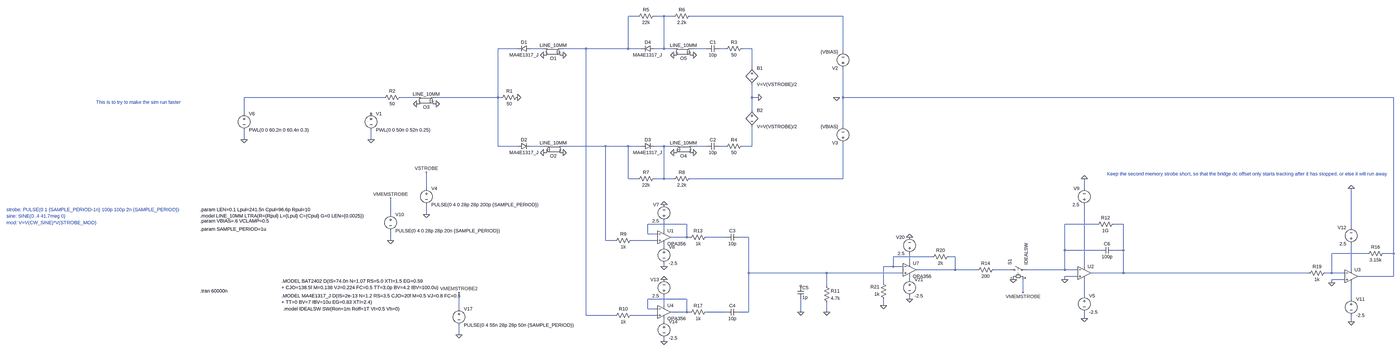
[diagram p0: schematic somewhat-usable.asc, whole sheet]
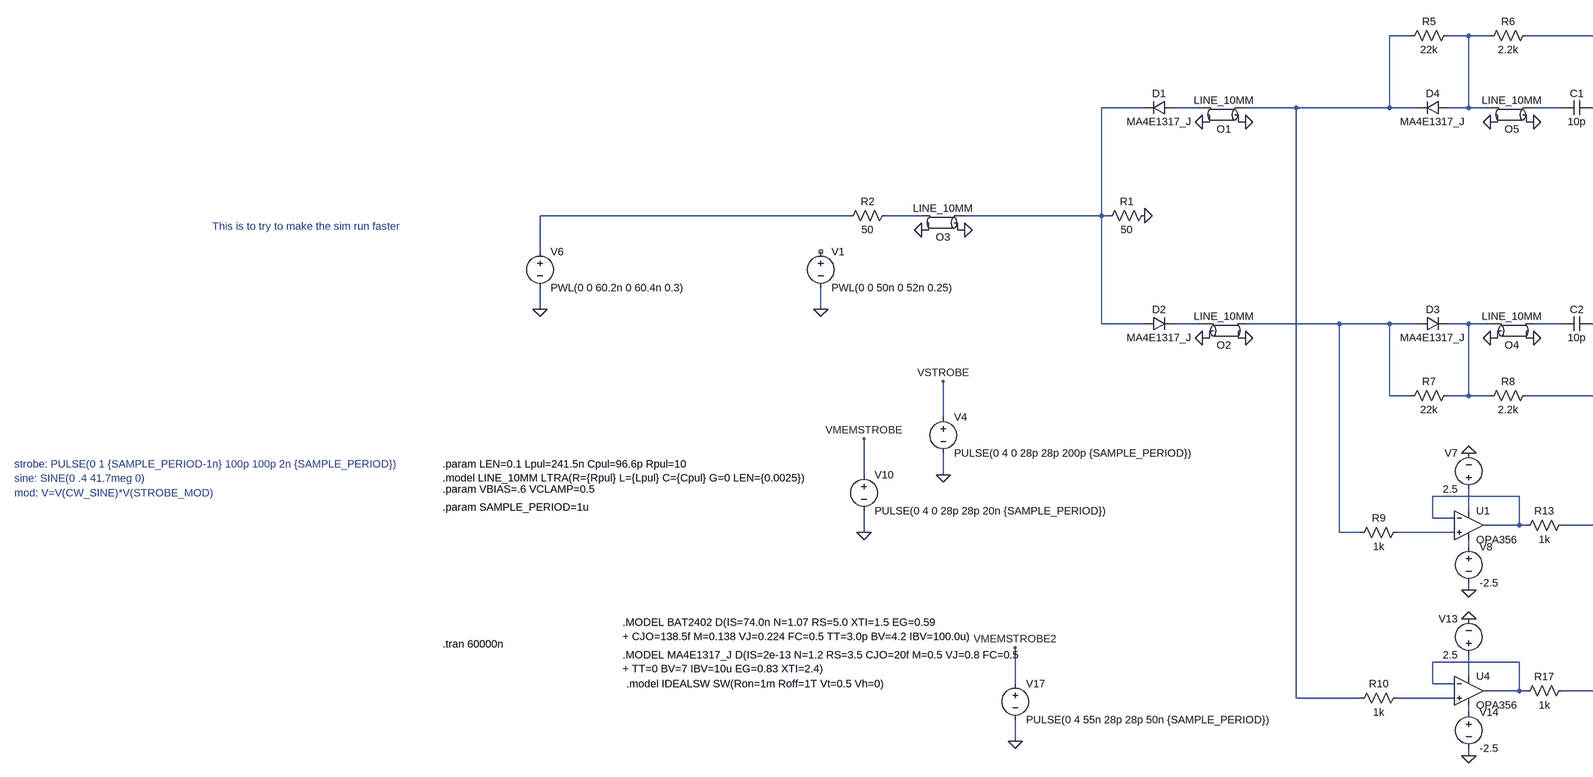
[diagram p1: schematic somewhat-usable.asc, part, row 1 of 1, column 1 of 2]
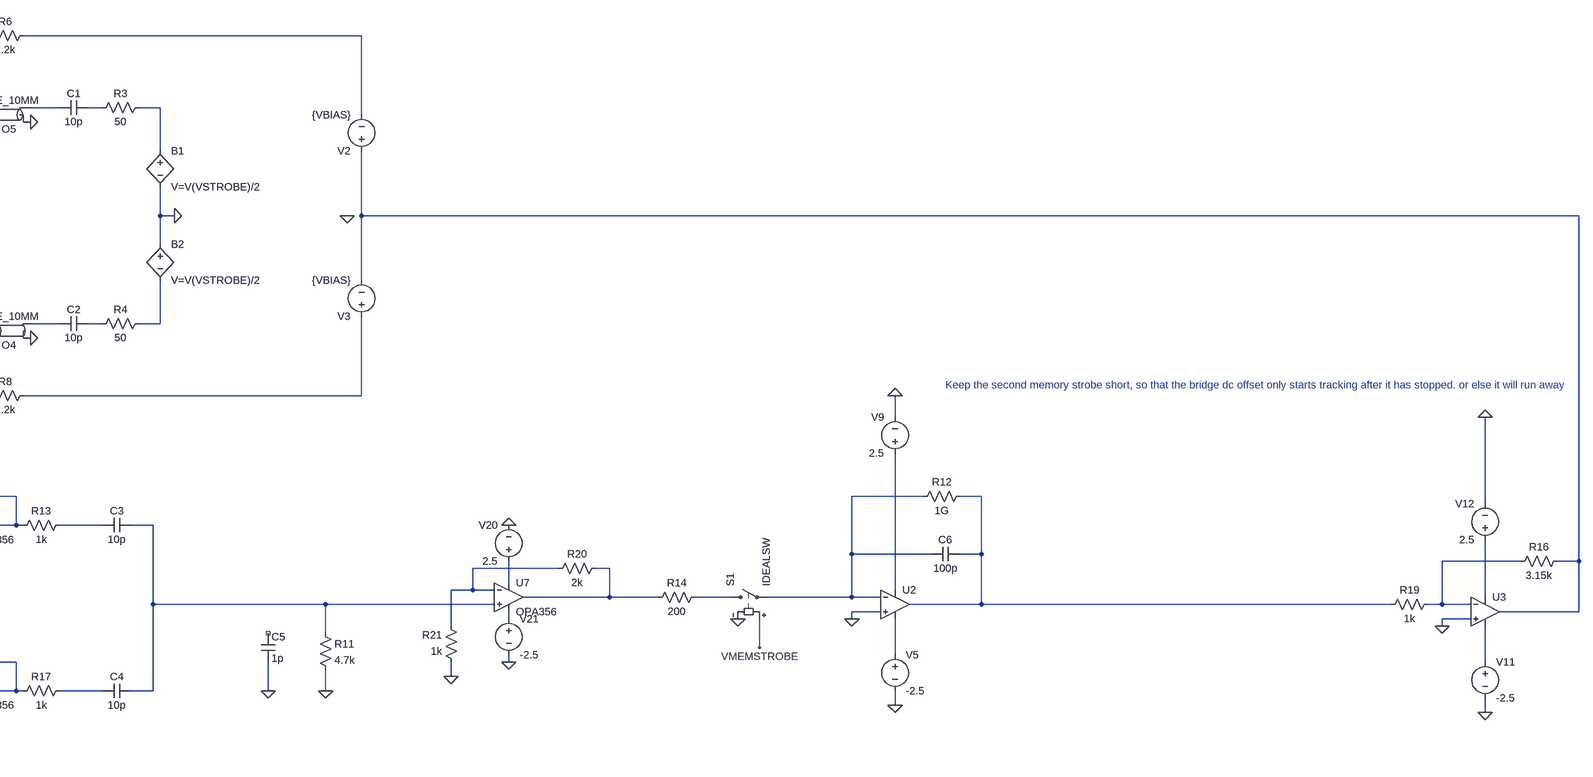
[diagram p2: schematic somewhat-usable.asc, part, row 1 of 1, column 2 of 2]
somewhat-usable.asc, the LTspice schematic file:
Version 4
SHEET 1 6100 1460
WIRE 1440 -656 1392 -656
WIRE 1568 -656 1520 -656
WIRE 1616 -656 1568 -656
WIRE 2448 -656 1696 -656
WIRE 848 -496 752 -496
WIRE 976 -496 912 -496
WIRE 1184 -496 1072 -496
WIRE 1392 -496 1392 -656
WIRE 1392 -496 1184 -496
WIRE 1456 -496 1392 -496
WIRE 1568 -496 1568 -656
WIRE 1568 -496 1520 -496
WIRE 1616 -496 1568 -496
WIRE 1776 -496 1712 -496
WIRE 1872 -496 1840 -496
WIRE 2000 -496 1952 -496
WIRE 2448 -480 2448 -656
WIRE 2000 -400 2000 -496
WIRE 192 -256 -496 -256
WIRE 352 -256 272 -256
WIRE 752 -256 752 -496
WIRE 752 -256 448 -256
WIRE 768 -256 752 -256
WIRE 2000 -256 2000 -320
WIRE 2032 -256 2000 -256
WIRE 2448 -256 2448 -400
WIRE 5504 -256 2448 -256
WIRE 2000 -192 2000 -256
WIRE -496 -176 -496 -256
WIRE 2448 -112 2448 -256
WIRE -496 -48 -496 -96
WIRE 128 -48 128 -96
WIRE 752 -16 752 -256
WIRE 848 -16 752 -16
WIRE 976 -16 912 -16
WIRE 1280 -16 1072 -16
WIRE 1392 -16 1280 -16
WIRE 1456 -16 1392 -16
WIRE 1568 -16 1520 -16
WIRE 1616 -16 1568 -16
WIRE 1776 -16 1712 -16
WIRE 1872 -16 1840 -16
WIRE 2000 -16 2000 -112
WIRE 2000 -16 1952 -16
WIRE 1392 144 1392 -16
WIRE 1440 144 1392 144
WIRE 1568 144 1568 -16
WIRE 1568 144 1520 144
WIRE 1616 144 1568 144
WIRE 2448 144 2448 -32
WIRE 2448 144 1696 144
WIRE 400 192 400 112
WIRE 3984 192 3984 144
WIRE 224 320 224 240
WIRE 400 320 400 272
WIRE 1680 368 1488 368
WIRE 4048 368 3888 368
WIRE 4176 368 4128 368
WIRE 5296 384 5296 192
WIRE 1568 400 1568 352
WIRE 1488 416 1488 368
WIRE 1536 416 1488 416
WIRE 1680 432 1680 368
WIRE 1680 432 1600 432
WIRE 1696 432 1680 432
WIRE 1872 432 1776 432
WIRE 1984 432 1936 432
WIRE 224 448 224 400
WIRE 1280 448 1280 -16
WIRE 1328 448 1280 448
WIRE 1536 448 1408 448
WIRE 1568 480 1568 464
WIRE 3888 496 3888 368
WIRE 4064 496 3888 496
WIRE 4176 496 4176 368
WIRE 4176 496 4128 496
WIRE 5376 512 5200 512
WIRE 5504 512 5504 -256
WIRE 5504 512 5456 512
WIRE 2912 528 2720 528
WIRE 3024 528 2992 528
WIRE 2800 560 2800 512
WIRE 1568 576 1568 560
WIRE 2720 576 2720 528
WIRE 2720 576 2672 576
WIRE 2768 576 2720 576
WIRE 3984 576 3984 272
WIRE 3024 592 3024 528
WIRE 3024 592 2832 592
WIRE 3312 592 3024 592
WIRE 3472 592 3392 592
WIRE 3888 592 3888 496
WIRE 3888 592 3552 592
WIRE 3952 592 3888 592
WIRE 5296 592 5296 464
WIRE 1984 608 1984 432
WIRE 2368 608 1984 608
WIRE 2768 608 2368 608
WIRE 4176 608 4176 496
WIRE 4176 608 4016 608
WIRE 5088 608 4176 608
WIRE 5200 608 5200 512
WIRE 5200 608 5168 608
WIRE 5264 608 5200 608
WIRE 3952 624 3888 624
WIRE 5504 624 5504 512
WIRE 5504 624 5328 624
WIRE 2800 640 2800 624
WIRE 3888 640 3888 624
WIRE 5264 640 5200 640
WIRE 2672 656 2672 576
WIRE 5200 656 5200 640
WIRE 2368 672 2368 608
WIRE 3536 704 3536 640
WIRE 3984 720 3984 640
WIRE 1680 736 1488 736
WIRE 2800 736 2800 720
WIRE 5296 736 5296 656
WIRE 1568 768 1568 720
WIRE 2672 768 2672 736
WIRE 560 784 560 704
WIRE 1488 784 1488 736
WIRE 1536 784 1488 784
WIRE 1680 800 1680 736
WIRE 1680 800 1600 800
WIRE 1696 800 1680 800
WIRE 1872 800 1776 800
WIRE 1984 800 1984 608
WIRE 1984 800 1936 800
WIRE 2240 800 2240 736
WIRE 2368 800 2368 752
WIRE 1184 816 1184 -496
WIRE 1328 816 1184 816
WIRE 1536 816 1408 816
WIRE 3984 832 3984 800
WIRE 1568 848 1568 832
WIRE 5296 848 5296 816
WIRE 560 912 560 864
WIRE 1568 944 1568 928
FLAG 128 -48 0
FLAG 1072 16 0
FLAG 976 16 0
FLAG 976 -464 0
FLAG 1072 -464 0
FLAG 448 -224 0
FLAG 352 -224 0
FLAG 848 -256 0
FLAG 1712 16 0
FLAG 1616 16 0
FLAG 1616 -464 0
FLAG 1712 -464 0
FLAG 2032 -256 0
FLAG 400 320 0
FLAG 400 112 VSTROBE
FLAG 2416 -256 0
FLAG -496 -48 0
FLAG 2368 800 0
FLAG 2240 800 0
FLAG 3888 640 0
FLAG 3984 144 0
FLAG 3984 832 0
FLAG 224 448 0
FLAG 224 240 VMEMSTROBE
FLAG 3536 704 VMEMSTROBE
FLAG 3488 640 0
FLAG 5200 656 0
FLAG 5296 192 0
FLAG 5296 848 0
FLAG 560 912 0
FLAG 560 704 VMEMSTROBE2
FLAG 2800 736 0
FLAG 2800 432 0
FLAG 2672 768 0
FLAG 1568 576 0
FLAG 1568 272 0
FLAG 1568 944 0
FLAG 1568 640 0
SYMBOL voltage 128 -192 R0
WINDOW 123 0 0 Left 0
WINDOW 39 0 0 Left 0
SYMATTR InstName V1
SYMATTR Value PWL(0 0 50n 0 52n 0.25)
SYMBOL diode 912 -512 R90
WINDOW 0 0 32 VBottom 2
WINDOW 3 32 32 VTop 2
SYMATTR InstName D1
SYMATTR Value MA4E1317_J
SYMBOL ltline 1024 -480 R180
SYMATTR InstName O1
SYMATTR Value LINE_10MM
SYMBOL ltline 1024 0 M180
SYMATTR InstName O2
SYMATTR Value LINE_10MM
SYMBOL diode 848 -32 M90
WINDOW 0 0 32 VBottom 2
WINDOW 3 32 32 VTop 2
SYMATTR InstName D2
SYMATTR Value MA4E1317_J
SYMBOL diode 1456 -32 M90
WINDOW 0 0 32 VBottom 2
WINDOW 3 32 32 VTop 2
SYMATTR InstName D3
SYMATTR Value MA4E1317_J
SYMBOL diode 1520 -512 R90
WINDOW 0 0 32 VBottom 2
WINDOW 3 32 32 VTop 2
SYMATTR InstName D4
SYMATTR Value MA4E1317_J
SYMBOL res 864 -272 R90
WINDOW 0 0 56 VBottom 2
WINDOW 3 32 56 VTop 2
SYMATTR InstName R1
SYMATTR Value 50
SYMBOL ltline 400 -240 R180
SYMATTR InstName O3
SYMATTR Value LINE_10MM
SYMBOL res 288 -272 R90
WINDOW 0 0 56 VBottom 2
WINDOW 3 32 56 VTop 2
SYMATTR InstName R2
SYMATTR Value 50
SYMBOL ltline 1664 0 M180
SYMATTR InstName O4
SYMATTR Value LINE_10MM
SYMBOL ltline 1664 -480 R180
SYMATTR InstName O5
SYMATTR Value LINE_10MM
SYMBOL cap 1840 -512 R90
WINDOW 0 0 32 VBottom 2
WINDOW 3 32 32 VTop 2
SYMATTR InstName C1
SYMATTR Value 10p
SYMBOL cap 1840 -32 R90
WINDOW 0 0 32 VBottom 2
WINDOW 3 32 32 VTop 2
SYMATTR InstName C2
SYMATTR Value 10p
SYMBOL res 1968 -512 R90
WINDOW 0 0 56 VBottom 2
WINDOW 3 32 56 VTop 2
SYMATTR InstName R3
SYMATTR Value 50
SYMBOL res 1968 -32 R90
WINDOW 0 0 56 VBottom 2
WINDOW 3 32 56 VTop 2
SYMATTR InstName R4
SYMATTR Value 50
SYMBOL voltage 400 176 R0
WINDOW 123 0 0 Left 0
WINDOW 39 0 0 Left 0
SYMATTR InstName V4
SYMATTR Value PULSE(0 4 0 28p 28p 200p {SAMPLE_PERIOD})
SYMBOL bv 2000 -416 R0
SYMATTR InstName B1
SYMATTR Value V=V(VSTROBE)/2
SYMBOL bv 2000 -208 R0
SYMATTR InstName B2
SYMATTR Value V=V(VSTROBE)/2
SYMBOL res 1536 -672 R90
WINDOW 0 0 56 VBottom 2
WINDOW 3 32 56 VTop 2
SYMATTR InstName R5
SYMATTR Value 22k
SYMBOL res 1712 -672 R90
WINDOW 0 0 56 VBottom 2
WINDOW 3 32 56 VTop 2
SYMATTR InstName R6
SYMATTR Value 2.2k
SYMBOL res 1536 128 R90
WINDOW 0 0 56 VBottom 2
WINDOW 3 32 56 VTop 2
SYMATTR InstName R7
SYMATTR Value 22k
SYMBOL res 1712 128 R90
WINDOW 0 0 56 VBottom 2
WINDOW 3 32 56 VTop 2
SYMATTR InstName R8
SYMATTR Value 2.2k
SYMBOL voltage 2448 -384 R180
WINDOW 123 0 0 Left 0
WINDOW 39 0 0 Left 0
SYMATTR InstName V2
SYMATTR Value {VBIAS}
SYMBOL voltage 2448 -16 R180
WINDOW 123 0 0 Left 0
WINDOW 39 0 0 Left 0
SYMATTR InstName V3
SYMATTR Value {VBIAS}
SYMBOL res 1424 432 R90
WINDOW 0 0 56 VBottom 2
WINDOW 3 32 56 VTop 2
SYMATTR InstName R9
SYMATTR Value 1k
SYMBOL res 1424 800 R90
WINDOW 0 0 56 VBottom 2
WINDOW 3 32 56 VTop 2
SYMATTR InstName R10
SYMATTR Value 1k
SYMBOL cap 1936 416 R90
WINDOW 0 0 32 VBottom 2
WINDOW 3 32 32 VTop 2
SYMATTR InstName C3
SYMATTR Value 10p
SYMBOL cap 1936 784 R90
WINDOW 0 0 32 VBottom 2
WINDOW 3 32 32 VTop 2
SYMATTR InstName C4
SYMATTR Value 10p
SYMBOL voltage -496 -192 R0
WINDOW 123 0 0 Left 0
WINDOW 39 0 0 Left 0
SYMATTR InstName V6
SYMATTR Value PWL(0 0 60.2n 0 60.4n 0.3)
SYMBOL res 2352 656 R0
SYMATTR InstName R11
SYMATTR Value 4.7k
SYMBOL cap 2224 672 R0
SYMATTR InstName C5
SYMATTR Value 1p
SYMBOL res 3408 576 R90
WINDOW 0 0 56 VBottom 2
WINDOW 3 32 56 VTop 2
SYMATTR InstName R14
SYMATTR Value 200
SYMBOL sw 3456 592 R270
SYMATTR InstName S1
SYMATTR Value IDEALSW
SYMBOL OpAmps\\UniversalOpamp2 3984 608 R0
SYMATTR InstName U2
SYMATTR Value2 Avol=1Meg GBW=100Meg Slew=100Meg
SYMBOL cap 4128 480 R90
WINDOW 0 0 32 VBottom 2
WINDOW 3 32 32 VTop 2
SYMATTR InstName C6
SYMATTR Value 100p
SYMBOL voltage 3984 704 R0
WINDOW 123 0 0 Left 0
WINDOW 39 0 0 Left 0
SYMATTR InstName V5
SYMATTR Value -2.5
SYMBOL voltage 3984 288 R180
WINDOW 0 24 96 Left 2
WINDOW 3 24 16 Left 2
WINDOW 123 0 0 Left 0
WINDOW 39 0 0 Left 0
SYMATTR InstName V9
SYMATTR Value 2.5
SYMBOL voltage 224 304 R0
WINDOW 123 0 0 Left 0
WINDOW 39 0 0 Left 0
SYMATTR InstName V10
SYMATTR Value PULSE(0 4 0 28p 28p 20n {SAMPLE_PERIOD})
SYMBOL OpAmps\\UniversalOpamp2 5296 624 R0
SYMATTR InstName U3
SYMATTR Value2 Avol=1Meg GBW=100Meg Slew=100Meg
SYMBOL voltage 5296 720 R0
WINDOW 123 0 0 Left 0
WINDOW 39 0 0 Left 0
SYMATTR InstName V11
SYMATTR Value -2.5
SYMBOL voltage 5296 480 R180
WINDOW 0 24 96 Left 2
WINDOW 3 24 16 Left 2
WINDOW 123 0 0 Left 0
WINDOW 39 0 0 Left 0
SYMATTR InstName V12
SYMATTR Value 2.5
SYMBOL res 5472 496 R90
WINDOW 0 0 56 VBottom 2
WINDOW 3 32 56 VTop 2
SYMATTR InstName R16
SYMATTR Value 3.15k
SYMBOL voltage 560 768 R0
WINDOW 123 0 0 Left 0
WINDOW 39 0 0 Left 0
SYMATTR InstName V17
SYMATTR Value PULSE(0 4 55n 28p 28p 50n {SAMPLE_PERIOD})
SYMBOL res 5184 592 R90
WINDOW 0 0 56 VBottom 2
WINDOW 3 32 56 VTop 2
SYMATTR InstName R19
SYMATTR Value 1k
SYMBOL OPA356 2800 528 R0
SYMATTR InstName U7
SYMBOL voltage 2800 528 R180
WINDOW 0 24 96 Left 2
WINDOW 3 24 16 Left 2
WINDOW 123 0 0 Left 0
WINDOW 39 0 0 Left 0
SYMATTR InstName V20
SYMATTR Value 2.5
SYMBOL voltage 2800 624 R0
WINDOW 123 0 0 Left 0
WINDOW 39 0 0 Left 0
SYMATTR InstName V21
SYMATTR Value -2.5
SYMBOL res 3008 512 R90
WINDOW 0 0 56 VBottom 2
WINDOW 3 32 56 VTop 2
SYMATTR InstName R20
SYMATTR Value 2k
SYMBOL res 2688 752 R180
WINDOW 0 36 76 Left 2
WINDOW 3 36 40 Left 2
SYMATTR InstName R21
SYMATTR Value 1k
SYMBOL res 4144 352 R90
WINDOW 0 0 56 VBottom 2
WINDOW 3 32 56 VTop 2
SYMATTR InstName R12
SYMATTR Value 1G
SYMBOL OPA356 1568 368 R0
SYMATTR InstName U1
SYMBOL voltage 1568 368 R180
WINDOW 0 24 96 Left 2
WINDOW 3 24 16 Left 2
WINDOW 123 0 0 Left 0
WINDOW 39 0 0 Left 0
SYMATTR InstName V7
SYMATTR Value 2.5
SYMBOL voltage 1568 464 R0
WINDOW 123 0 0 Left 0
WINDOW 39 0 0 Left 0
SYMATTR InstName V8
SYMATTR Value -2.5
SYMBOL OPA356 1568 736 R0
SYMATTR InstName U4
SYMBOL voltage 1568 736 R180
WINDOW 0 24 96 Left 2
WINDOW 3 24 16 Left 2
WINDOW 123 0 0 Left 0
WINDOW 39 0 0 Left 0
SYMATTR InstName V13
SYMATTR Value 2.5
SYMBOL voltage 1568 832 R0
WINDOW 123 0 0 Left 0
WINDOW 39 0 0 Left 0
SYMATTR InstName V14
SYMATTR Value -2.5
SYMBOL res 1792 416 R90
WINDOW 0 0 56 VBottom 2
WINDOW 3 32 56 VTop 2
SYMATTR InstName R13
SYMATTR Value 1k
SYMBOL res 1792 784 R90
WINDOW 0 0 56 VBottom 2
WINDOW 3 32 56 VTop 2
SYMATTR InstName R17
SYMATTR Value 1k
TEXT -312 648 Left 2 !.MODEL BAT2402 D(IS=74.0n N=1.07 RS=5.0 XTI=1.5 EG=0.59\n+ CJO=138.5f M=0.138 VJ=0.224 FC=0.5 TT=3.0p BV=4.2 IBV=100.0u)
TEXT -712 296 Left 2 !.param LEN=0.1 Lpul=241.5n Cpul=96.6p Rpul=10\n.model LINE_10MM LTRA(R={Rpul} L={Lpul} C={Cpul} G=0 LEN={0.0025})
TEXT -712 696 Left 2 !.tran 60000n
TEXT -712 352 Left 2 !.param VBIAS=.6 VCLAMP=0.5
TEXT -312 720 Left 2 !.MODEL MA4E1317_J D(IS=2e-13 N=1.2 RS=3.5 CJO=20f M=0.5 VJ=0.8 FC=0.5\n+ TT=0 BV=7 IBV=10u EG=0.83 XTI=2.4)
TEXT -1224 -232 Left 2 ;This is to try to make the sim run faster
TEXT -712 392 Left 2 !.param SAMPLE_PERIOD=1u
TEXT -1664 296 Left 2 ;strobe: PULSE(0 1 {SAMPLE_PERIOD-1n} 100p 100p 2n {SAMPLE_PERIOD})
TEXT -1664 328 Left 2 ;sine: SINE(0 .4 41.7meg 0)
TEXT -1664 360 Left 2 ;mod: V=V(CW_SINE)*V(STROBE_MOD)
TEXT -304 784 Left 2 !.model IDEALSW SW(Ron=1m Roff=1T Vt=0.5 Vh=0)
TEXT 4096 120 Left 2 ;Keep the second memory strobe short, so that the bridge dc offset only starts tracking after it has stopped. or else it will run away

The netlist it stands for:
* somewhat-usable.asc
V1 NC_01 0 PWL(0 0 50n 0 52n 0.25)
D1 N005 N004 MA4E1317_J
O1 0 N001 0 N005 LINE_10MM
O2 0 N012 0 N013 LINE_10MM
D2 N004 N012 MA4E1317_J
D3 N013 N014 MA4E1317_J
D4 N002 N001 MA4E1317_J
R1 0 N004 50
O3 0 N004 0 N010 LINE_10MM
R2 N010 N009 50
O4 0 N014 0 N015 LINE_10MM
O5 0 N006 0 N002 LINE_10MM
C1 N007 N006 10p
C2 N016 N015 10p
R3 N008 N007 50
R4 N017 N016 50
V4 VSTROBE 0 PULSE(0 4 0 28p 28p 200p {SAMPLE_PERIOD})
B1 N008 0 V=V(VSTROBE)/2
B2 0 N017 V=V(VSTROBE)/2
R5 N002 N001 22k
R6 N003 N002 2.2k
R7 N014 N013 22k
R8 N018 N014 2.2k
V2 N011 N003 {VBIAS}
V3 N018 N011 {VBIAS}
R9 N025 N013 1k
R10 N040 N001 1k
C3 N024 N023 10p
C4 N024 N039 10p
V6 N009 0 PWL(0 0 60.2n 0 60.4n 0.3)
R11 N024 0 4.7k
C5 NC_02 0 1p
R14 N032 N029 200
S1 N032 N020 VMEMSTROBE 0 IDEALSW
XU2 0 N020 N031 N035 N021 level.2 Avol=1Meg GBW=100Meg Slew=100Meg ilimit=25m rail=0 Vos=0 phimargin=45 en=0 enk=0 in=0 ink=0 Rin=500Meg  ; pins IN+ IN- V+ V- OUT
C6 N021 N020 100p
V5 N035 0 -2.5
V9 N031 0 2.5
V10 VMEMSTROBE 0 PULSE(0 4 0 28p 28p 20n {SAMPLE_PERIOD})
XU3 0 N027 N033 N037 N011 level.2 Avol=1Meg GBW=100Meg Slew=100Meg ilimit=25m rail=0 Vos=0 phimargin=45 en=0 enk=0 in=0 ink=0 Rin=500Meg  ; pins IN+ IN- V+ V- OUT
V11 N037 0 -2.5
V12 N033 0 2.5
R16 N011 N027 3.15k
V17 VMEMSTROBE2 0 PULSE(0 4 55n 28p 28p 50n {SAMPLE_PERIOD})
R19 N027 N021 1k
* U7: OPA356 (symbol OPA356 not available, pins judged from their places): In+=N024 In-=N028 V+=N030 V-=N034 OUT=N029
V20 N030 0 2.5
V21 N034 0 -2.5
R20 N029 N028 2k
R21 0 N028 1k
R12 N021 N020 1G
* U1: OPA356 (symbol OPA356 not available, pins judged from their places): In+=N025 In-=N019 V+=N022 V-=N026 OUT=N019
V7 N022 0 2.5
V8 N026 0 -2.5
* U4: OPA356 (symbol OPA356 not available, pins judged from their places): In+=N040 In-=N036 V+=N038 V-=N041 OUT=N036
V13 N038 0 2.5
V14 N041 0 -2.5
R13 N023 N019 1k
R17 N039 N036 1k
.model D D
.lib standard.dio
.MODEL BAT2402 D(IS=74.0n N=1.07 RS=5.0 XTI=1.5 EG=0.59
+ CJO=138.5f M=0.138 VJ=0.224 FC=0.5 TT=3.0p BV=4.2 IBV=100.0u)
.param LEN=0.1 Lpul=241.5n Cpul=96.6p Rpul=10
.model LINE_10MM LTRA(R={Rpul} L={Lpul} C={Cpul} G=0 LEN={0.0025})
.tran 60000n
.param VBIAS=.6 VCLAMP=0.5
.MODEL MA4E1317_J D(IS=2e-13 N=1.2 RS=3.5 CJO=20f M=0.5 VJ=0.8 FC=0.5
+ TT=0 BV=7 IBV=10u EG=0.83 XTI=2.4)
* This is to try to make the sim run faster
.param SAMPLE_PERIOD=1u
* strobe: PULSE(0 1 {SAMPLE_PERIOD-1n} 100p 100p 2n {SAMPLE_PERIOD})
* sine: SINE(0 .4 41.7meg 0)
* mod: V=V(CW_SINE)*V(STROBE_MOD)
.model IDEALSW SW(Ron=1m Roff=1T Vt=0.5 Vh=0)
* Keep the second memory strobe short, so that the bridge dc offset only starts tracking after it has stopped. or else it will run away
.lib UniversalOpamps2.sub
.backanno
.end